# Altium schematic sheet Copy of MCU.SchDoc
size A3; SheetNumber: 6; SheetTotal: 9
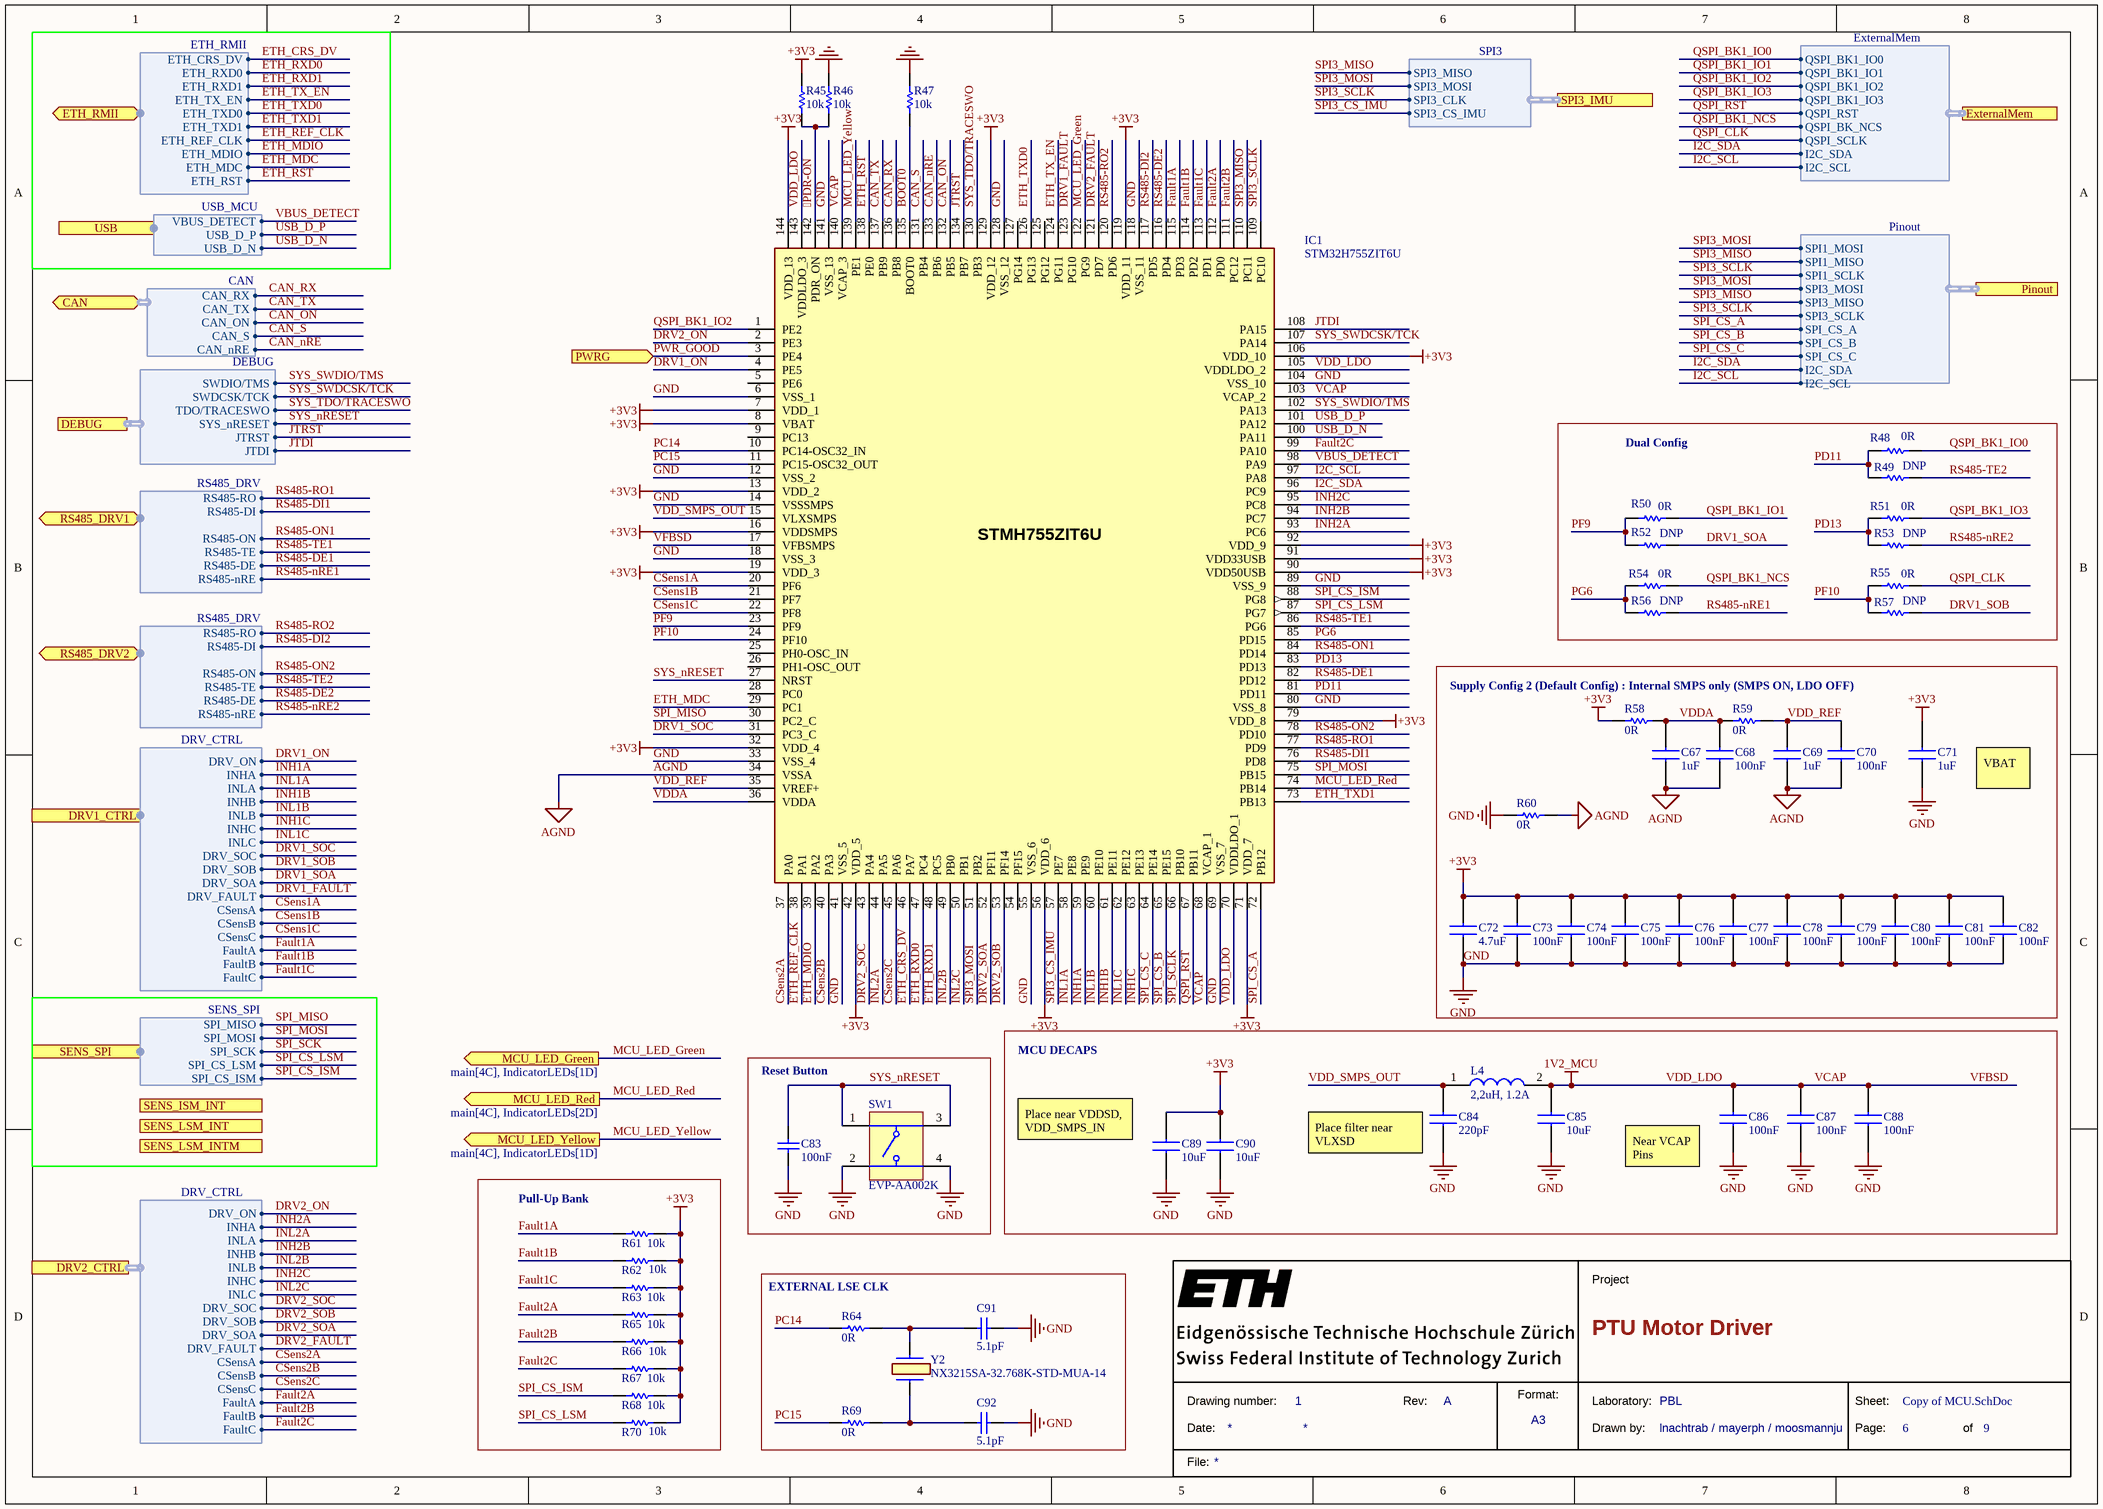
[diagram p0: Copy of MCU.SchDoc]

## Parts
C67  1uF  [CAPC1608X90N]
C68  100nF  [CAPC1608X90N]
C69  1uF  [CAPC1608X90N]
C70  100nF  [CAPC1608X90N]
C71  1uF  [CAPC1608X90N]
C72  4.7uF  [CAPC1608X95N]
C73  100nF  [CAPC1608X90N]
C74  100nF  [CAPC1608X90N]
C75  100nF  [CAPC1608X90N]
C76  100nF  [CAPC1608X90N]
C77  100nF  [CAPC1608X90N]
C78  100nF  [CAPC1608X90N]
C79  100nF  [CAPC1608X90N]
C80  100nF  [CAPC1608X90N]
C81  100nF  [CAPC1608X90N]
C82  100nF  [CAPC1608X90N]
C83  100nF  [CAPC1005X55X25ML05T10]
C84  220pF  [CAPC1608X87N]
C85  10uF  [CAPC2013X140N]
C86  100nF  [CAPC1608X90N]
C87  100nF  [CAPC1608X90N]
C88  100nF  [CAPC1608X90N]
C89  10uF  [CAPC2013X140N]
C90  10uF  [CAPC2013X140N]
C91  5.1pF  [CAPC1005X70N]
C92  5.1pF  [CAPC1005X70N]
IC1  STM32H755ZIT6U  [QFP50P2200X2200X160-144N]
L4  2,2uH, 1.2A  [LQM2MPN1R0NG0L]
R45  10k  [RESC2012X70N]
R46  10k  [RESC2012X70N]
R47  10k  [RESC2012X70N]
R48  0R  [RESC1005X40X25NL05T10]
R49  DNP  [RESC1005X40X25NL05T10]
R50  0R  [RESC1005X40X25NL05T10]
R51  0R  [RESC1005X40X25NL05T10]
R52  DNP  [RESC1005X40X25NL05T10]
R53  DNP  [RESC1005X40X25NL05T10]
R54  0R  [RESC1005X40X25NL05T10]
R55  0R  [RESC1005X40X25NL05T10]
R56  DNP  [RESC1005X40X25NL05T10]
R57  DNP  [RESC1005X40X25NL05T10]
R58  0R  [RESC1005X40X25LL05T10]
R59  0R  [RESC1005X40X25LL05T10]
R60  0R  [RESC1005X40X25LL05T10]
R61  10k  [RESC2012X70N]
R62  10k  [RESC2012X70N]
R63  10k  [RESC2012X70N]
R64  0R  [RESC1005X40X25LL05T10]
R65  10k  [RESC2012X70N]
R66  10k  [RESC2012X70N]
R67  10k  [RESC2012X70N]
R68  10k  [RESC2012X70N]
R69  0R  [RESC1005X40X25LL05T10]
R70  10k  [RESC2012X70N]
SW1  EVP-AA002K  [PNSC-EVPAA_V]
Y2  NX3215SA-32.768K-STD-MUA-14  [NX3215SA32768KSTDMUA8]

## Blocks framed on the sheet
Dual Config: R48-R57
MCU DECAPS: C84-C90 L4
Reset Button: C83 SW1
Pull-Up Bank: R61-R63 R65-R68 R70
EXTERNAL LSE CLK: C91 C92 R64 R69 Y2

## Ports
CAN (bidir, harness CAN, see main[5A], CAN[1B]), DEBUG (harness DEBUG, see main[5C], Debug[3B]), DRV1_CTRL (harness DRV_CTRL, see main[4B], DebugBreakout[1A]), DRV2_CTRL (harness DRV_CTRL, see main[4B], DebugBreakout[1B]), ETH_RMII (bidir, harness ETH_RMII, see main[4A], ETH[1A]), ExternalMem (harness ExternalMem, see main[5B], Memory[1B]), MCU_LED_Green (out, see main[4C], IndicatorLEDs[1D]), MCU_LED_Red (out, see main[4C], IndicatorLEDs[2D]), MCU_LED_Yellow (out, see main[4C], IndicatorLEDs[1D]), Pinout (harness Pinout, see main[4C], DebugBreakout[7B]), PWRG (in, see main[5C]), RS485_DRV1 (bidir, harness RS485_DRV, see main[4C], DebugBreakout[1C]), RS485_DRV2 (bidir, harness RS485_DRV, see main[4C], DebugBreakout[1C]), SENS_ISM_INT (out, see MAIN[3C]), SENS_LSM_INT (out, see MAIN[3C]), SENS_LSM_INTM (out, see MAIN[3C]), SENS_SPI (harness SENS_SPI, see MAIN[3C]), SPI3_IMU (harness SPI3, see main[5B], IMU[1B]), USB (harness USB_MCU, see main[4B], USB_C[4B])

## Harnesses
ETH_RMII: ETH_REF_CLK, ETH_MDIO, ETH_MDC, ETH_CRS_DV, ETH_TX_EN, ETH_RXD0, ETH_RXD1, ETH_TXD0, ETH_TXD1, ETH_RST
USB_MCU: USB_D_P, USB_D_N, VBUS_DETECT
DRV_CTRL: DRV_ON, INHA, INLA, INHB, INLB, INHC, INLC, DRV_SOC, DRV_SOB, DRV_SOA, DRV_FAULT, CSensA, CSensB, CSensC, FaultA, FaultB, FaultC
RS485_DRV: RS485-RO, RS485-DI, RS485-DE, RS485-nRE, RS485-ON, RS485-TE
DEBUG: SWDIO/TMS, SWDCSK/TCK, TDO/TRACESWO, SYS_nRESET, JTRST, JTDI
ExternalMem: QSPI_BK1_IO0, QSPI_BK1_IO1, QSPI_BK1_IO2, QSPI_BK1_IO3, QSPI_RST, QSPI_BK_NCS, QSPI_SCLK, I2C_SDA, I2C_SCL
SPI3: SPI3_MISO, SPI3_MOSI, SPI3_CLK, SPI3_CS_IMU
Pinout: SPI1_MOSI, SPI1_MISO, SPI1_SCLK, SPI3_MOSI, SPI3_MISO, SPI3_SCLK, SPI_CS_A, SPI_CS_B, SPI_CS_C, I2C_SDA, I2C_SCL
CAN: CAN_RX, CAN_TX, CAN_ON, CAN_S, CAN_nRE
SENS_SPI: SPI_SCK, SPI_MOSI, SPI_MISO, SPI_CS_LSM, SPI_CS_ISM

## Nets
+3V3: C71.2 C72.1 C73.2 C74.2 C75.2 C76.2 C77.2 C78.2 C79.2 C80.2 C81.2 C82.2 C89.2 C90.2 IC1.7(VDD_1) IC1.8(VBAT) IC1.13(VDD_2) IC1.16(VDDSMPS) IC1.19(VDD_3) IC1.32(VDD_4) IC1.42(VDD_5) IC1.56(VDD_6) IC1.71(VDD_7) IC1.79(VDD_8) IC1.90(VDD50USB) IC1.91(VDD33USB) IC1.92(VDD_9) IC1.106(VDD_10) IC1.119(VDD_11) IC1.129(VDD_12) IC1.144(VDD_13) R45.2 R58.1 R61.2 R62.2 R63.2 R65.2 R66.2 R67.2 R68.2 R70.2
AGND: C67.1 C68.1 C69.1 C70.1 IC1.34(VSSA) R60.2
GND: C71.1 C72.2 C73.1 C74.1 C75.1 C76.1 C77.1 C78.1 C79.1 C80.1 C81.1 C82.1 C83.1 C84.2 C85.1 C86.1 C87.1 C88.1 C89.1 C90.1 C91.2 C92.2 IC1.6(VSS_1) IC1.12(VSS_2) IC1.14(VSSSMPS) IC1.18(VSS_3) IC1.33(VSS_4) IC1.41(VSS_5) IC1.55(VSS_6) IC1.69(VSS_7) IC1.80(VSS_8) IC1.89(VSS_9) IC1.104(VSS_10) IC1.118(VSS_11) IC1.128(VSS_12) IC1.141(VSS_13) R46.2 R47.2 R60.1 SW1.2(B) SW1.4(B')
VCAP: C85.2 C86.2 C87.2 C88.2 IC1.17(VFBSMPS) IC1.68(VCAP_1) IC1.70(VDDLDO_1) IC1.103(VCAP_2) IC1.105(VDDLDO_2) IC1.140(VCAP_3) IC1.143(VDDLDO_3) L4.2  [also labelled 1V2_MCU, VDD_LDO, VFBSD]
PDR-ON: IC1.142(PDR_ON) R45.1 R46.1
BOOT0: IC1.135(BOOT0) R47.1
CAN_nRE: IC1.133(PB6) ; port CAN.CAN_nRE
CAN_ON: IC1.132(PB5) ; port CAN.CAN_ON
CAN_RX: IC1.136(PB8) ; port CAN.CAN_RX
CAN_S: IC1.131(PB4) ; port CAN.CAN_S
CAN_TX: IC1.137(PB9) ; port CAN.CAN_TX
CSens1A: IC1.20(PF6) ; port DRV1_CTRL.CSensA
CSens1B: IC1.21(PF7) ; port DRV1_CTRL.CSensB
CSens1C: IC1.22(PF8) ; port DRV1_CTRL.CSensC
CSens2A: IC1.37(PA0) ; port DRV2_CTRL.CSensA
CSens2B: IC1.40(PA3) ; port DRV2_CTRL.CSensB
CSens2C: IC1.45(PA6) ; port DRV2_CTRL.CSensC
DRV1_FAULT: IC1.123(PG10) ; port DRV1_CTRL.DRV_FAULT
DRV1_ON: IC1.4(PE5) ; port DRV1_CTRL.DRV_ON
DRV1_SOA: R52.2 ; port DRV1_CTRL.DRV_SOA
DRV1_SOB: R57.2 ; port DRV1_CTRL.DRV_SOB
DRV1_SOC: IC1.31(PC3_C) ; port DRV1_CTRL.DRV_SOC
DRV2_FAULT: IC1.121(PD7) ; port DRV2_CTRL.DRV_FAULT
DRV2_ON: IC1.2(PE3) ; port DRV2_CTRL.DRV_ON
DRV2_SOA: IC1.52(PF11) ; port DRV2_CTRL.DRV_SOA
DRV2_SOB: IC1.53(PF14) ; port DRV2_CTRL.DRV_SOB
DRV2_SOC: IC1.43(PA4) ; port DRV2_CTRL.DRV_SOC
ETH_CRS_DV: IC1.46(PA7) ; port ETH_RMII.ETH_CRS_DV
ETH_MDC: IC1.29(PC1) ; port ETH_RMII.ETH_MDC
ETH_MDIO: IC1.39(PA2) ; port ETH_RMII.ETH_MDIO
ETH_REF_CLK: IC1.38(PA1) ; port ETH_RMII.ETH_REF_CLK
ETH_RST: IC1.138(PE0) ; port ETH_RMII.ETH_RST
ETH_RXD0: IC1.47(PC4) ; port ETH_RMII.ETH_RXD0
ETH_RXD1: IC1.48(PC5) ; port ETH_RMII.ETH_RXD1
ETH_TX_EN: IC1.124(PG11) ; port ETH_RMII.ETH_TX_EN
ETH_TXD0: IC1.126(PG13) ; port ETH_RMII.ETH_TXD0
ETH_TXD1: IC1.73(PB13) ; port ETH_RMII.ETH_TXD1
Fault1A: IC1.115(PD3) R61.1 ; port DRV1_CTRL.FaultA
Fault1B: IC1.114(PD2) R62.1 ; port DRV1_CTRL.FaultB
Fault1C: IC1.113(PD1) R63.1 ; port DRV1_CTRL.FaultC
Fault2A: IC1.112(PD0) R65.1 ; port DRV2_CTRL.FaultA
Fault2B: IC1.111(PC12) R66.1 ; port DRV2_CTRL.FaultB
Fault2C: IC1.99(PA10) R67.1 ; port DRV2_CTRL.FaultC
I2C_SCL: IC1.97(PA8) ; port ExternalMem.I2C_SCL, port Pinout.I2C_SCL
I2C_SDA: IC1.96(PC9) ; port ExternalMem.I2C_SDA, port Pinout.I2C_SDA
INH1A: IC1.59(PE9) ; port DRV1_CTRL.INHA
INH1B: IC1.61(PE11) ; port DRV1_CTRL.INHB
INH1C: IC1.63(PE13) ; port DRV1_CTRL.INHC
INH2A: IC1.93(PC6) ; port DRV2_CTRL.INHA
INH2B: IC1.94(PC7) ; port DRV2_CTRL.INHB
INH2C: IC1.95(PC8) ; port DRV2_CTRL.INHC
INL1A: IC1.58(PE8) ; port DRV1_CTRL.INLA
INL1B: IC1.60(PE10) ; port DRV1_CTRL.INLB
INL1C: IC1.62(PE12) ; port DRV1_CTRL.INLC
INL2A: IC1.44(PA5) ; port DRV2_CTRL.INLA
INL2B: IC1.49(PB0) ; port DRV2_CTRL.INLB
INL2C: IC1.50(PB1) ; port DRV2_CTRL.INLC
JTDI: IC1.108(PA15) ; port DEBUG.JTDI
JTRST: IC1.134(PB7) ; port DEBUG.JTRST
MCU_LED_Green: IC1.122(PG9) ; port MCU_LED_Green
MCU_LED_Red: IC1.74(PB14) ; port MCU_LED_Red
MCU_LED_Yellow: IC1.139(PE1) ; port MCU_LED_Yellow
PC14: IC1.10(PC14-OSC32_IN) R64.1
PC15: IC1.11(PC15-OSC32_OUT) R69.1
PD11: IC1.81(PD11) R48.1 R49.1
PD13: IC1.83(PD13) R51.1 R53.1
PF9: IC1.23(PF9) R50.1 R52.1
PF10: IC1.24(PF10) R55.1 R57.1
PG6: IC1.85(PD15) R54.1 R56.1
PWR_GOOD: IC1.3(PE4) ; port PWRG
QSPI_BK1_IO0: R48.2 ; port ExternalMem.QSPI_BK1_IO0
QSPI_BK1_IO1: R50.2 ; port ExternalMem.QSPI_BK1_IO1
QSPI_BK1_IO2: IC1.1(PE2) ; port ExternalMem.QSPI_BK1_IO2
QSPI_BK1_IO3: R51.2 ; port ExternalMem.QSPI_BK1_IO3
QSPI_BK1_NCS: R54.2 ; port ExternalMem.QSPI_BK_NCS
QSPI_CLK: R55.2 ; port ExternalMem.QSPI_SCLK
QSPI_RST: IC1.67(PB11) ; port ExternalMem.QSPI_RST
RS485-DE1: IC1.82(PD12) ; port RS485_DRV1.RS485-DE
RS485-DE2: IC1.116(PD4) ; port RS485_DRV2.RS485-DE
RS485-DI1: IC1.76(PD8) ; port RS485_DRV1.RS485-DI
RS485-DI2: IC1.117(PD5) ; port RS485_DRV2.RS485-DI
RS485-nRE1: R56.2 ; port RS485_DRV1.RS485-nRE
RS485-nRE2: R53.2 ; port RS485_DRV2.RS485-nRE
RS485-ON1: IC1.84(PD14) ; port RS485_DRV1.RS485-ON
RS485-ON2: IC1.78(PD10) ; port RS485_DRV2.RS485-ON
RS485-RO1: IC1.77(PD9) ; port RS485_DRV1.RS485-RO
RS485-RO2: IC1.120(PD6) ; port RS485_DRV2.RS485-RO
RS485-TE1: IC1.86(PG6) ; port RS485_DRV1.RS485-TE
RS485-TE2: R49.2 ; port RS485_DRV2.RS485-TE
SPI3_CS_IMU: IC1.57(PE7) ; port SPI3_IMU.SPI3_CS_IMU
SPI3_MISO: IC1.110(PC11) ; port SPI3_IMU.SPI3_MISO, port Pinout.SPI1_MISO, port Pinout.SPI3_MISO
SPI3_MOSI: IC1.51(PB2) ; port SPI3_IMU.SPI3_MOSI, port Pinout.SPI1_MOSI, port Pinout.SPI3_MOSI
SPI3_SCLK: IC1.109(PC10) ; port SPI3_IMU.SPI3_CLK, port Pinout.SPI1_SCLK, port Pinout.SPI3_SCLK
SPI_CS_A: IC1.72(PB12) ; port Pinout.SPI_CS_A
SPI_CS_B: IC1.65(PE15) ; port Pinout.SPI_CS_B
SPI_CS_C: IC1.64(PE14) ; port Pinout.SPI_CS_C
SPI_CS_ISM: IC1.88(PG8) R68.1 ; port SENS_SPI.SPI_CS_ISM
SPI_CS_LSM: IC1.87(PG7) R70.1 ; port SENS_SPI.SPI_CS_LSM
SPI_MISO: IC1.30(PC2_C) ; port SENS_SPI.SPI_MISO
SPI_MOSI: IC1.75(PB15) ; port SENS_SPI.SPI_MOSI
SPI_SCK: port SENS_SPI.SPI_SCK
SPI_SCLK: IC1.66(PB10)
SYS_nRESET: C83.2 IC1.27(NRST) SW1.1(A) SW1.3(A') ; port DEBUG.SYS_nRESET
SYS_SWDCSK/TCK: IC1.107(PA14) ; port DEBUG.SWDCSK/TCK
SYS_SWDIO/TMS: IC1.102(PA13) ; port DEBUG.SWDIO/TMS
SYS_TDO/TRACESWO: IC1.130(PB3) ; port DEBUG.TDO/TRACESWO
USB_D_N: IC1.100(PA11) ; port USB.USB_D_N
USB_D_P: IC1.101(PA12) ; port USB.USB_D_P
VBUS_DETECT: IC1.98(PA9) ; port USB.VBUS_DETECT
VDD_REF: C69.2 C70.2 IC1.35(VREF+) R59.2
VDD_SMPS_OUT: C84.1 IC1.15(VLXSMPS) L4.1
VDDA: C67.2 C68.2 IC1.36(VDDA) R58.2 R59.1
NetC91_1: C91.1 R64.2 Y2.1
NetC92_1: C92.1 R69.2 Y2.2(CRYSTAL_2)

Not connected (* = marked no-connect by the designer): IC1 5(PE6) 9(PC13) 25(PH0-OSC_IN) 26(PH1-OSC_OUT) 28(PC0) 54(PF15) 125(PG12) 127(PG14)

## Notes on the sheet
- (near IC1) STMH755ZIT6U
- Supply Config 2 (Default Config) : Internal SMPS only (SMPS ON, LDO OFF)
- VBAT
- (near C89) Place near VDDSD, VDD_SMPS_IN
- (near C84) Place filter near VLXSD
- (near C86) Near VCAP Pins
- Project
- Format:
- PTU Motor Driver
- Drawing number:
- Date:
- 1
- Rev:
- A
- A3
- Laboratory:
- Drawn by:
- PBL
- lnachtrab / mayerph / moosmannju
- Sheet:
- Page:
- of
- File:

## Library data of the parts
C67 C69 C71 = CL10B105KP8NNNC: Capacitor 1uF 0603; Manufacturer_Name: SAMSUNG; Datasheet Link: https://media.digikey.com/pdf/Data%20Sheets/Samsung%20PDFs/CL_Series_MLCC_ds.pdf; Height: 0.9mm; Mouser Part Number: 187-CL10B105KP8NNNC; Mouser Price/Stock: https://www.mouser.co.uk/ProductDetail/Samsung-Electro-Mechanics/CL10B105KP8NNNC?qs=X6jEic%2FHinD9krOsbkFZow%3D%3D; Arrow Part Number: CL10B105KP8NNNC; Arrow Price/Stock: https://www.arrow.com/en/products/cl10b105kp8nnnc/samsung-electro-mechanics?region=europe; Supplier 1: Digikey; Supplier Part Number 1: 1276-1946-1-ND; Manufacturer Part Number: CL10B105KP8NNNC
C68 C70 C73-C82 C86-C88 = CC0603KRX7R7BB104: Capacitor 100nF 0603; Manufacturer_Name: YAGEO; Datasheet Link: https://www.yageo.com/en/Chart/Download/pdf/CC0603KRX7R7BB104; Height: 0.9mm; Mouser Part Number: 603-CC603KRX7R7BB104; Mouser Price/Stock: https://www.mouser.co.uk/ProductDetail/YAGEO/CC0603KRX7R7BB104?qs=AgBp2OyFlx8KPmNTlFoWXA%3D%3D; Arrow Part Number: CC0603KRX7R7BB104; Arrow Price/Stock: https://www.arrow.com/en/products/cc0603krx7r7bb104/yageo?utm_currency=USD&region=europe; Manufacturer Part Number: CC0603KRX7R7BB104; Supplier 1: Mouser; Supplier Part Number 1: 603-CC603KRX7R7BB104
C72 = CL10B475KQ8NQNC: Capacitor 4.7uF 0603; Manufacturer_Name: SAMSUNG; Datasheet Link: https://datasheet.datasheetarchive.com/originals/distributors/Datasheets-DGA10/2410603.pdf; Height: 0.95mm; Mouser Part Number: 187-CL10B475KQ8NQNC; Mouser Price/Stock: https://www.mouser.co.uk/ProductDetail/Samsung-Electro-Mechanics/CL10B475KQ8NQNC?qs=6tbHoouHnQxd6rcaSwpT7Q%3D%3D; Arrow Part Number: CL10B475KQ8NQNC; Arrow Price/Stock: https://www.arrow.com/en/products/cl10b475kq8nqnc/samsung-electro-mechanics; Supplier 1: Digikey; Supplier Part Number 1: 1276-2087-1-ND; Manufacturer Part Number: CL10B475KQ8NQNC
C83 = GRM155R71H104KE14J: Capacitor 100nF 0402 - storage; Manufacturer: Murata; Tolerance: 10%; Dielectric: X7R; Voltage Rating (DC): 50V; Supplier 1: Digi-Key; Manufacturer Part Number: GRM155R71H104KE14J; RoHS: Yes; Category: Ceramic Capacitors; Stock 1: 1916144; Pricing 1: 1=0.10000, 10=0.03800, 100=0.01680, 500=0.01198, 1000=0.00941, 2500=0.00855, 5000=0.00787 (USD); Mount: Surface Mount; Case/Package: 0402; Weight: 0.000212oz; Case Code (Imperial): 0402; Case Code (Metric): 1005; Min Operating Temperature: -55°C; Max Operating Temperature: 125°C; Termination: SMD/SMT; Composition: Ceramic; Package Quantity: 50000; Packaging: Tape and Reel; Value: 100nF; Voltage Rating: 50V; Length: 0.039inch; Height: 0.5mm; Width: 0.5mm; Thickness: 0.022inch; Lead Free: Lead Free; ComponentLink1URL: http://search.murata.co.jp/Ceramy/image/img/A01X/G101/ENG/GRM155R71H104KE14-01.pdf?src-supplier=Mouser; ComponentLink1Description: http://search.murata.co.jp/Ceramy/image/img/A01X/G101/ENG/GRM155R71H104KE14-01.pdf?src-supplier=Mouser; ComponentLink2URL: http://search.murata.co.jp/Ceramy/image/img/A01X/G101/ENG/GRM155R71H104KE14-01.pdf?src-supplier=Digi-Key; ComponentLink2Description: http://search.murata.co.jp/Ceramy/image/img/A01X/G101/ENG/GRM155R71H104KE14-01.pdf?src-supplier=Digi-Key; ComponentLink3URL: http://search.murata.co.jp/Ceramy/image/img/A01X/G101/ENG/GRM155R71H104KE14-01.pdf?src-supplier=Avnet; ComponentLink3Description: http://search.murata.co.jp/Ceramy/image/img/A01X/G101/ENG/GRM155R71H104KE14-01.pdf?src-supplier=Avnet; ComponentLink4URL: http://search.murata.co.jp/Ceramy/image/img/A01X/G101/ENG/GRM155R71H104KE14-01.pdf?src-supplier=Avnet+Europe; ComponentLink4Description: http://search.murata.co.jp/Ceramy/image/img/A01X/G101/ENG/GRM155R71H104KE14-01.pdf?src-supplier=Avnet+Europe; Supplier Part Number 1: 490-13342-1-ND
C84 = 0603B221K500CT: Capacitor 220pF 0603; Manufacturer_Name: Walsin Technology Corporation; Datasheet Link: http://www.passivecomponent.com/wp-content/uploads/datasheet/WTC_MLCC_General_Purpose.pdf; Height: 0.87mm; Supplier 1: Digikey; Supplier Part Number 1: 1292-1407-1-ND; Manufacturer Part Number: 0603B221K500CT
C85 C89 C90 = LMK212AB7106MG-T: Capacitor 10uF 0805; Manufacturer_Name: TAIYO YUDEN; Datasheet Link: https://datasheet.datasheetarchive.com/originals/distributors/Datasheets-DGA20/25674.pdf; Height: 1.4mm; Mouser Part Number: 963-LMK212AB7106MG-T; Mouser Price/Stock: https://www.mouser.co.uk/ProductDetail/Taiyo-Yuden/LMK212AB7106MG-T?qs=CNQs48zzdnrud19jlu61Cg%3D%3D; Supplier 1: Digikey; Supplier Part Number 1: 587-3417-1-ND; Manufacturer Part Number: LMK212AB7106MG-T
C91 C92 = GRM1555C1H5R1CA01D: Capacitor 5.1pF/50V 0402; Manufacturer_Name: Murata Electronics; Datasheet Link: https://search.murata.co.jp/Ceramy/image/img/A01X/G101/ENG/GRM1555C1H5R1CA01-01A.pdf; Height: 0.7mm; Manufacturer Part Number: GRM1555C1H5R1CA01D; Mouser Part Number: 81-GRM1555C1H5R1CA1D; Mouser Price/Stock: https://www.mouser.com/Search/Refine.aspx?Keyword=81-GRM1555C1H5R1CA1D; Arrow Part Number: GRM1555C1H5R1CA01D; Arrow Price/Stock: https://www.arrow.com/en/products/grm1555c1h5r1ca01d/murata-manufacturing?region=nac
IC1 = STM32H755ZIT6U: STM32H755 MCU; Manufacturer_Name: STMicroelectronics; Datasheet Link: https://www.st.com/resource/en/datasheet/stm32h755zi.pdf; Height: 1.6mm; Mouser Part Number: 511-STM32H755ZIT6U; Mouser Price/Stock: https://www.mouser.com/Search/Refine.aspx?Keyword=511-STM32H755ZIT6U; Supplier 1: Heisener; Supplier Part Number 1: STM32H755ZIT6U; Manufacturer Part Number: STM32H755ZIT6U
L4 = LQM2MPN2R2MG0L: Inductor; Manufacturer_Name: Murata Electronics; Datasheet Link: https://search.murata.co.jp/Ceramy/image/img/P02/JELF243B-0022.pdf; Height: 1mm; Mouser Part Number: 81-LQM2MPN2R2MG0L; Mouser Price/Stock: https://www.mouser.co.uk/ProductDetail/Murata-Electronics/LQM2MPN2R2MG0L?qs=YinlzBdtFMj9%2Fj5t8GanUg%3D%3D; Arrow Part Number: LQM2MPN2R2MG0L; Arrow Price/Stock: https://www.arrow.com/en/products/lqm2mpn2r2mg0l/murata-manufacturing?utm_currency=USD&region=nac; Supplier 1: Mouser; Supplier Part Number 1: 81-LQM2MPN2R2MG0L; Manufacturer Part Number: LQM2MPN2R2MG0L
R45-R47 R61-R63 R65-R68 R70 = ERJ-6GEYJ103V: Resistor 10k 0805; Manufacturer_Name: Panasonic; Datasheet Link: https://datasheet.datasheetarchive.com/originals/distributors/DKDS40/DSANUWW0010911.pdf; Height: 0.7mm; Mouser Part Number: 667-ERJ-6GEYJ103V; Mouser Price/Stock: https://www.mouser.co.uk/ProductDetail/Panasonic/ERJ-6GEYJ103V?qs=tQNqqtTOejK5rw%252BRxJVxUA%3D%3D; Arrow Part Number: ERJ-6GEYJ103V; Arrow Price/Stock: https://www.arrow.com/en/products/erj6geyj103v/panasonic?region=nac; Supplier 1: Mouser; Supplier Part Number 1: 71-CRCW0603-10K-E3; Supplier 2: Digikey; Supplier Part Number 2: P10KADKR-ND; Manufacturer Part Number: ERJ-6GEYJ103V
R48-R57 = CMP-009-00183-1: Resistor 0R 0402; Manufacturer: Vishay Dale; Manufacturer Part Number: CRCW04020000Z0EDHP; Power: 200mW; Min Operating Temperature: -55°C; Pins: 2; Case/Package: 0402; Mounting Technology: Surface Mount; Max Operating Temperature: 155°C; RoHS Compliant: Yes; Component Type: Resistors; Supplier 1: Digikey; Supplier Part Number 1: 541-0.0YBCT-ND; Value: 0R
R58-R60 R64 R69 = CMP-2002-03041-1: Resistor 0R 0402; Part Number: CRCW04020000Z0EDHP; Manufacturer: Vishay Dale; Value: 0Ohm; Voltage Rating: 50V; Power Rating: 200mW; Temperature Coefficient: 0ppm/°C; Max Power Dissipation: 125mW; Supplier 1: Digi-Key; Supplier Part Number 1: 541-0.0YBCT-ND; Manufacturer Part Number: CRCW04020000Z0EDHP; RoHS: Yes; Category: Chip SMD Resistors; Stock 1: 527407; Pricing 1: 1=0.13000, 10=0.11300, 25=0.07840, 50=0.06080, 100=0.04350, 250=0.03388, 500=0.02694, 1000=0.01912, 5000=0.01477 (USD); Mount: Surface Mount; Case/Package: 0402; Weight: 2.3E-05oz; Case Code (Metric): 1005; Case Code (Imperial): 0402; Contact Plating: Tin; Min Operating Temperature: -55°C; Max Operating Temperature: 155°C; Packaging: Tape and Reel; Composition: Thick Film; Termination: SMD/SMT; Voltage Rating (DC): 50V; Package Quantity: 1; Military Standard: Not; Number of Terminations: 2; Features: Automotive AEC-Q200; Length: 1mm; Height: 0.3mm; Width: 0.02inch; Depth: 0.5mm; Radiation Hardening: No; REACH SVHC: Unknown; Lead Free: Lead Free; ComponentLink1URL: https://datasheet.ciiva.com/16494/crcwhpe3-16494453.pdf?src-supplier=Future+Electronics; ComponentLink1Description: https://datasheet.ciiva.com/16494/crcwhpe3-16494453.pdf?src-supplier=Future+Electronics; ComponentLink2URL: https://datasheet.ciiva.com/2470/crcwhpe3-2470555.pdf?src-supplier=Digi-Key; ComponentLink2Description: https://datasheet.ciiva.com/2470/crcwhpe3-2470555.pdf?src-supplier=Digi-Key; ComponentLink3URL: https://datasheet.ciiva.com/5562/crcwhpe3-46056-5562315.pdf?src-supplier=Mouser; ComponentLink3Description: https://datasheet.ciiva.com/5562/crcwhpe3-46056-5562315.pdf?src-supplier=Mouser; ComponentLink4URL: https://datasheet.ciiva.com/9109/crcwhpe3-9109963.pdf?src-supplier=Avnet; ComponentLink4Description: https://datasheet.ciiva.com/9109/crcwhpe3-9109963.pdf?src-supplier=Avnet; ComponentLink5URL: https://datasheet.ciiva.com/2470/crcwhpe3-2470556.pdf?src-supplier=Digi-Key; ComponentLink5Description: https://datasheet.ciiva.com/2470/crcwhpe3-2470556.pdf?src-supplier=Digi-Key; ComponentLink6URL: https://datasheet.ciiva.com/28621/1912814-28621324.pdf?src-supplier=Element14; ComponentLink6Description: https://datasheet.ciiva.com/28621/1912814-28621324.pdf?src-supplier=Element14; ComponentLink7URL: https://datasheet.ciiva.com/2470/crcwhpe3-2470557.pdf?src-supplier=Digi-Key; ComponentLink7Description: https://datasheet.ciiva.com/2470/crcwhpe3-2470557.pdf?src-supplier=Digi-Key; ComponentLink8URL: https://datasheet.ciiva.com/7725/crcwhpe3-7725758.pdf?src-supplier=Element14; ComponentLink8Description: https://datasheet.ciiva.com/7725/crcwhpe3-7725758.pdf?src-supplier=Element14
SW1 = CMP-2000-06231-1: Light Touch Switch, 100 mOhm, -40 to 85 degC, 4-Pin SMD, RoHS, Tape and Reel; Manufacturer: Panasonic; Electrical Life: 1000000Cycles; Switch Configuration: N.O.; COO: JP; Actuator Color: Black; Contact Rating @ Voltage: 0.02@1+5VDCA; Dielectric Strength: 250VAC; Actuator Length: 0.3mm; Ground Terminal: No; Operating Force: 1N; Pole Throw Configuration: SPST; Body Orientation: Straight; Illumination Type: N/R; Maximum DC Voltage Rating: 1+5V; Actuator Style: RectangularButton; Maximum AC Voltage Rating: N/A; Package Description: 4-Pin Surface Mount Device, Body 2.9 x 3.5 mm, Pitch 1.45 mm; Family: EVPAA; Contact Material: N/A; Mounting: SurfaceMount,J-Bend; Datasheet Version: 04/2016; Housing Material: N/A; Product Weight: N/A; RoHS: Yes; Mechanical Life: N/A; Minimum Insulation Resistance: 100MOhm; Operating Temperature: -40to85C; Mounting Technology: SurfaceMount; HTS: 8507204000; Dimension: 4.3x2.9x1.7mm; Maximum Contact Resistance: 100mOhm; Base Material: N/A; Seal Location: N/A; Supplier Standard Pack: 5,000; Supplier: PanasonicIndustrialDevices; Datasheet URL: https://industrial.panasonic.com/cdbs/www-data/pdf/ATV0000/ATV0000C1.pdf; Packaging: EmbossedTapeandReel; Manufacturer URL: http://www.panasonic.com/; Seal Description: N/A; Contact Plating: N/A; ECCN: EAR99; Package Reference: EVPAA; Type: LightTouch; Part No: EVP-AA002K; Supplier Part Number: P13347SDKR-ND; Manufacturer Part Number: EVP-AA002K; Category: Tactile Switches; Stock: 749; Pricing: 1=0.8, 10=0.774, 25=0.744, 100=0.6459, 250=0.5894, 500=0.54772, 1000=0.49116, 2500=0.46139 (USD); ComponentLink1URL: https://datasheet.ciiva.com/24076/atk0000pe184-69004-24076293.pdf?src-supplier=Mouser; ComponentLink1Description: https://datasheet.ciiva.com/24076/atk0000pe184-69004-24076293.pdf?src-supplier=Mouser; ComponentLink2URL: https://datasheet.ciiva.com/2899/atk0000ce26-2899990.pdf?src-supplier=Digikey; ComponentLink2Description: https://datasheet.ciiva.com/2899/atk0000ce26-2899990.pdf?src-supplier=Digikey; ComponentLink3URL: https://datasheet.ciiva.com/2899/atk0000ce26-2899991.pdf?src-supplier=Digikey; ComponentLink3Description: https://datasheet.ciiva.com/2899/atk0000ce26-2899991.pdf?src-supplier=Digikey; ComponentLink4URL: https://datasheet.ciiva.com/2899/atk0000ce26-2899992.pdf?src-supplier=Digikey; ComponentLink4Description: https://datasheet.ciiva.com/2899/atk0000ce26-2899992.pdf?src-supplier=Digikey
Y2 = NX3215SA-32.768K-STD-MUA-14: Crystal or Oscillator - 6pF Load; Manufacturer_Name: NDK; Datasheet Link: https://www.arrow.com/en/products/nx3215sa32.768kstdmua8/ndk; Height: 0.9mm; Manufacturer Part Number: NX3215SA-32.768K-STD-MUA-14; Mouser Part Number: 344-NX3215SA32768K8; Mouser Price/Stock: https://www.mouser.co.uk/ProductDetail/NDK/NX3215SA-32.768K-STD-MUA-8?qs=55YtniHzbhBdnrw6egvs7Q%3D%3D; Arrow Part Number: NX3215SA-32.768K-STD-MUA-8; Arrow Price/Stock: https://www.arrow.com/en/products/nx3215sa32.768kstdmua8/ndk; Supplier 1: Mouser; Supplier Part Number 1: 344-NX3215SA32768K8